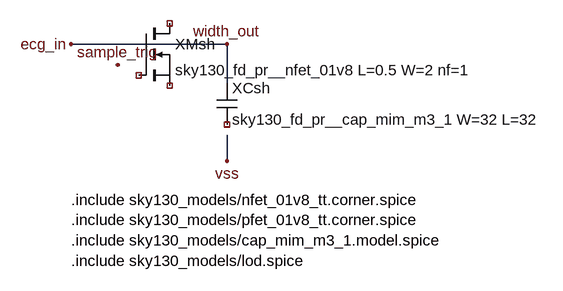
[diagram p0: schematic qrs_width_schematic_F6.asc]
qrs_width_schematic_F6.asc, the LTspice schematic file:
Version 4.1
SHEET 1 800 600
WIRE 0 0 -120 0
WIRE 0 0 120 0
WIRE 120 0 120 60
WIRE 120 140 120 180
FLAG -120 0 ecg_in
FLAG -48 32 sample_trig
FLAG 120 0 width_out
FLAG 120 180 vss
SYMBOL nmos -16 -32 R0
SYMATTR InstName XMsh
SYMATTR Value sky130_fd_pr__nfet_01v8 L=0.5 W=2 nf=1
SYMBOL cap 104 60 R0
SYMATTR InstName XCsh
SYMATTR Value sky130_fd_pr__cap_mim_m3_1 W=32 L=32
TEXT -120 240 Left 2 !.include sky130_models/nfet_01v8_tt.corner.spice\n.include sky130_models/pfet_01v8_tt.corner.spice\n.include sky130_models/cap_mim_m3_1.model.spice\n.include sky130_models/lod.spice

The netlist it stands for:
* qrs_width_schematic_F6.asc
M§XMsh NC_01 NC_02 NC_03 NC_03 sky130_fd_pr__nfet_01v8 L=0.5 W=2 nf=1
C§XCsh width_out NC_04 sky130_fd_pr__cap_mim_m3_1 W=32 L=32
.model NMOS NMOS
.model PMOS PMOS
.lib standard.mos
.include sky130_models/nfet_01v8_tt.corner.spice
.include sky130_models/pfet_01v8_tt.corner.spice
.include sky130_models/cap_mim_m3_1.model.spice
.include sky130_models/lod.spice
.backanno
.end